# Altium schematic sheet Misc Peripherals.SchDoc
size A; SheetNumber: 5; SheetTotal: 5
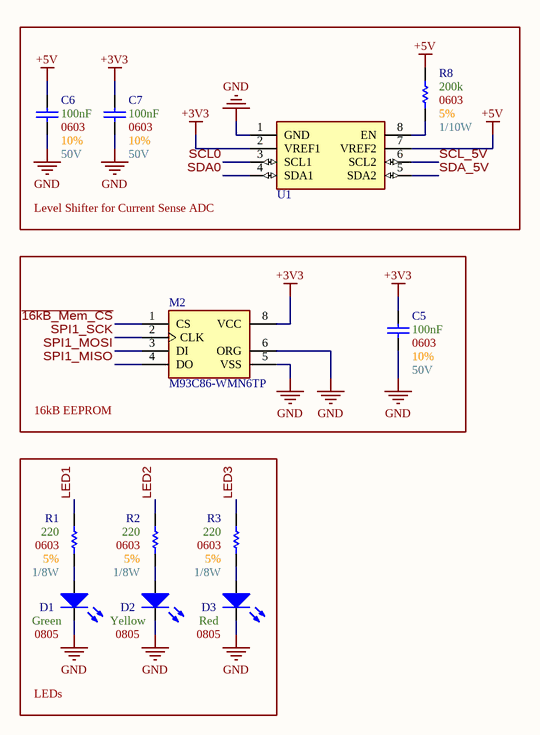
[diagram p0: Misc Peripherals.SchDoc]

## Parts
C5  Max Voltage: 50V  Size Package: 0603  Tolerance: 10%  Capacitance: 100nF  [[Cap] SMD 0603]  (hidden comment: [Cap] 0603 0.1uF 10% 50V)
C6  Max Voltage: 50V  Size Package: 0603  Tolerance: 10%  Capacitance: 100nF  [[Cap] SMD 0603]  (hidden comment: [Cap] 0603 0.1uF 10% 50V)
C7  Max Voltage: 50V  Size Package: 0603  Tolerance: 10%  Capacitance: 100nF  [[Cap] SMD 0603]  (hidden comment: [Cap] 0603 0.1uF 10% 50V)
D1  Color: Green  Size Package: 0805  [[LED] SMD 0805]  (hidden comment: [LED] SMD 0805 Green)
D2  Color: Yellow  Size Package: 0805  [[LED] SMD 0805]  (hidden comment: [LED] SMD 0805 Yellow)
D3  Color: Red  Size Package: 0805  [[LED] SMD 0805]  (hidden comment: [LED] SMD 0805 Red)
M2  M93C86-WMN6TP  [8-SOIC]
R1  Wattage: 1/8W  Tolerance: 5%  Resistance: 220  Size Package: 0603  [[Res] SMD 0603]  (hidden comment: [220] SMD 0603 5% 1/10W)
R2  Wattage: 1/8W  Tolerance: 5%  Resistance: 220  Size Package: 0603  [[Res] SMD 0603]  (hidden comment: [220] SMD 0603 5% 1/10W)
R3  Wattage: 1/8W  Tolerance: 5%  Resistance: 220  Size Package: 0603  [[Res] SMD 0603]  (hidden comment: [220] SMD 0603 5% 1/10W)
R8  Wattage: 1/10W  Tolerance: 5%  Resistance: 200k  Size Package: 0603  [[Res] SMD 0603]  (hidden comment: [200k] SMD 0603 1% 1/10W)
U1  [Level Shifter] I2C Level Shifter  [[Level Shifter] I2C Level Shifter]  (value not drawn)

## Blocks framed on the sheet
Level Shifter for Current Sense ADC: C6 C7 R8 U1
16kB EEPROM: C5 M2
LEDs: D1-D3 R1-R3

## Nets
+3V3: C5.2 C7.2 M2.8(VCC) U1.2(VREF1)
+5V: C6.2 R8.2 U1.7(VREF2)
GND: C5.1 C6.1 C7.1 D1.2(Cathode) D2.2(Cathode) D3.2(Cathode) M2.5(VSS) M2.6(ORG) U1.1(GND)
~{16kB_Mem_CS}: M2.1(CS)
LED1: R1.2
LED2: R2.2
LED3: R3.2
SCL0: U1.3(SCL1)
SCL_5V: U1.6(SCL2)
SDA0: U1.4(SDA1)
SDA_5V: U1.5(SDA2)
SPI1_MISO: M2.4(DO)
SPI1_MOSI: M2.3(DI)
SPI1_SCK: M2.2(CLK)
NetD1_1: D1.1(Anode) R1.1
NetD2_1: D2.1(Anode) R2.1
NetD3_1: D3.1(Anode) R3.1
NetR8_1: R8.1 U1.8(EN)

## Library data of the parts
C5-C7 = [Cap] 0603 0.1uF 10% 50V: CL10B104KB8NNNC; Supplier 1: DigiKey; Supplier Part Number 1: 1276-1000-6-ND
D1 = [LED] SMD 0805 Green: LG R971-KN-1-0-20-R18; Supplier 1: DigiKey; Supplier Part Number 1: 475-LGR971-KN-1CT-ND
D2 = [LED] SMD 0805 Yellow: LY R976-PS-36-0-20-R18; Supplier 1: DigiKey; Supplier Part Number 1: 475-LYR976-PS-36-0-20-R18CT-ND
D3 = [LED] SMD 0805 Red: LS R976-NR-1-0-20-R18; Supplier 1: DigiKey; Supplier Part Number 1: 475-LSR976-NR-1CT-ND
M2 = [Flash] 16kb: Supplier 1: DigiKey; Supplier Part Number 1: 497-8665-1-ND
R1-R3 = [220] SMD 0603 5% 1/10W: RK73B1JTTD221J; Supplier 1: DigiKey; Supplier Part Number 1: 2019-RK73B1JTTD221JDKR-ND
R8 = [200k] SMD 0603 1% 1/10W: RC0603JR-07200KL; Supplier 1: DigiKey; Supplier Part Number 1: 311-200KGRCT-ND
U1 = [Level Shifter] I2C Level Shifter: PCA9306DCTR; Supplier 1: DigiKey; Supplier Part Number 1: 296-18509-1-ND